# Altium schematic sheet Schematic of drumpad.schdoc
size 252 x 147 mm
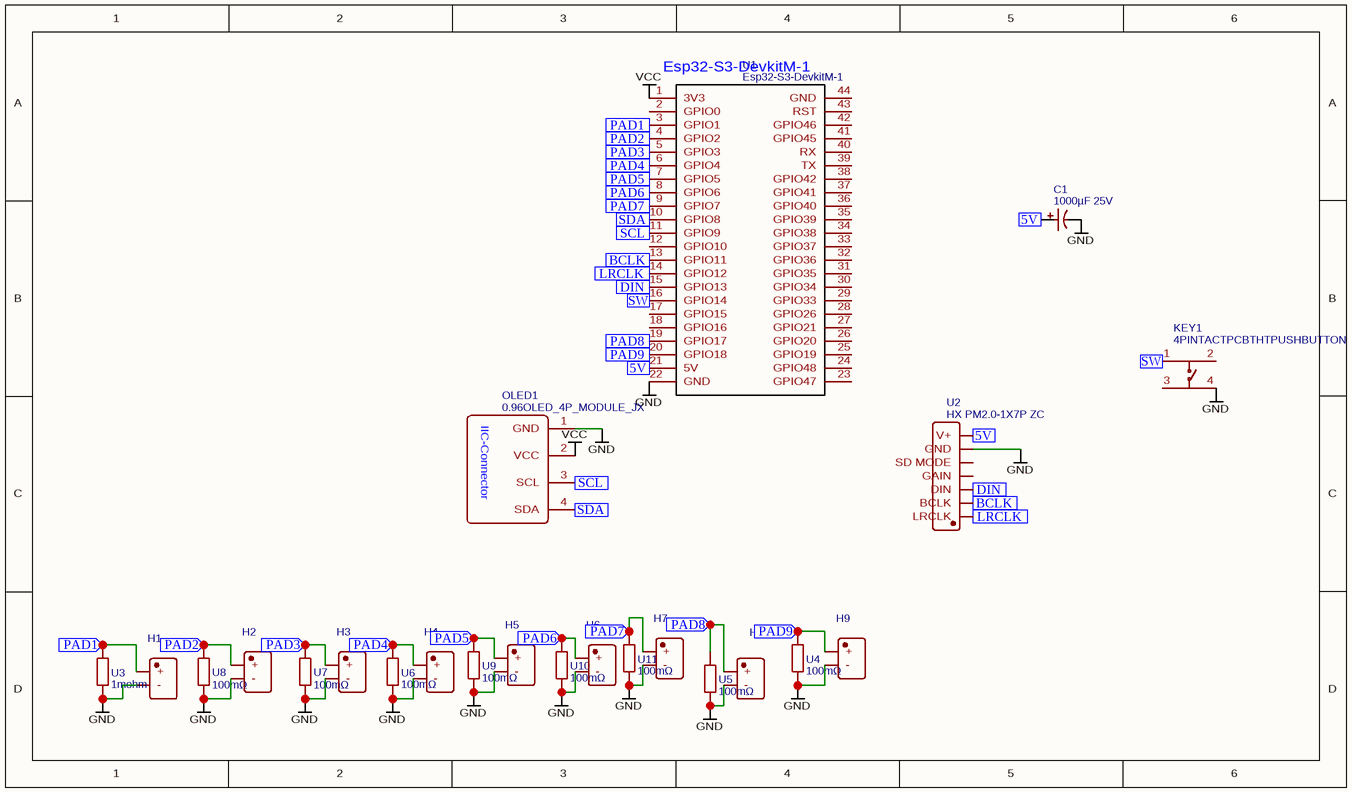
[diagram p0: Schematic of drumpad.schdoc]

## Parts
C1  1000µF 25V  [CAP-TH_BD10.0-P5.00-D1.0-FD]
H1  880-70-002-10-001101  [HDR-TH_2P-P2.00-V-M]  (value not drawn)
H2  880-70-002-10-001101  [HDR-TH_2P-P2.00-V-M]  (value not drawn)
H3  880-70-002-10-001101  [HDR-TH_2P-P2.00-V-M]  (value not drawn)
H4  880-70-002-10-001101  [HDR-TH_2P-P2.00-V-M]  (value not drawn)
H5  880-70-002-10-001101  [HDR-TH_2P-P2.00-V-M]  (value not drawn)
H6  880-70-002-10-001101  [HDR-TH_2P-P2.00-V-M]  (value not drawn)
H7  880-70-002-10-001101  [HDR-TH_2P-P2.00-V-M]  (value not drawn)
H8  880-70-002-10-001101  [HDR-TH_2P-P2.00-V-M]  (value not drawn)
H9  880-70-002-10-001101  [HDR-TH_2P-P2.00-V-M]  (value not drawn)
KEY1  4PINTACTPCBTHTPUSHBUTTON  [SW-SMD_4P-L6.0-W6.0-P4.50-LS10.0_TL3301EF160QG]
OLED1  0.96OLED_4P_MODULE_JX  [0.96OLED_4P]
U1  Esp32-S3-DevkitM-1  [ESP32-S3-DEVKITM-1]
U2  HX PM2.0-1X7P ZC  [HDR-TH_HX-PM2.0-1X7P-ZC]
U3  1mohm  [RES-TH_BD3.5-L9.0-P13.00-D0.5]
U4  100mΩ  [RES-TH_BD3.5-L9.0-P13.00-D0.5]
U5  100mΩ  [RES-TH_BD3.5-L9.0-P13.00-D0.5]
U6  100mΩ  [RES-TH_BD3.5-L9.0-P13.00-D0.5]
U7  100mΩ  [RES-TH_BD3.5-L9.0-P13.00-D0.5]
U8  100mΩ  [RES-TH_BD3.5-L9.0-P13.00-D0.5]
U9  100mΩ  [RES-TH_BD3.5-L9.0-P13.00-D0.5]
U10  100mΩ  [RES-TH_BD3.5-L9.0-P13.00-D0.5]
U11  100mΩ  [RES-TH_BD3.5-L9.0-P13.00-D0.5]

## Ports
5V (in), BCLK (in), DIN (in), LRCLK (in), PAD1 (in), PAD2 (in), PAD3 (in), PAD4 (in), PAD5 (in), PAD6 (in), PAD7 (in), PAD8 (in), PAD9 (in), SCL (in), SDA (in), SW (in)

## Nets
GND: C1.2 H1.2(-) H2.2(-) H3.2(-) H4.2(-) H5.2(-) H6.2(-) H7.2(-) H8.2(-) H9.2(-) KEY1.4 OLED1.1(GND) U1.22(GND) U2.6(GND) U3.1 U4.1 U5.1 U6.1 U7.1 U8.1 U9.1 U10.1 U11.1
VCC: OLED1.2(VCC) U1.1(3V3)
5V: C1.1 U1.21(5V) U2.7(V+) ; port 5V
BCLK: U1.13(GPIO11) U2.2(BCLK) ; port BCLK
DIN: U1.15(GPIO13) U2.3(DIN) ; port DIN
LRCLK: U1.14(GPIO12) U2.1(LRCLK) ; port LRCLK
PAD1: H1.1(+) U1.3(GPIO1) U3.2 ; port PAD1
PAD2: H2.1(+) U1.4(GPIO2) U8.2 ; port PAD2
PAD3: H3.1(+) U1.5(GPIO3) U7.2 ; port PAD3
PAD4: H4.1(+) U1.6(GPIO4) U6.2 ; port PAD4
PAD5: H5.1(+) U1.7(GPIO5) U9.2 ; port PAD5
PAD6: H6.1(+) U1.8(GPIO6) U10.2 ; port PAD6
PAD7: H7.1(+) U1.9(GPIO7) U11.2 ; port PAD7
PAD8: H8.1(+) U1.19(GPIO17) U5.2 ; port PAD8
PAD9: H9.1(+) U1.20(GPIO18) U4.2 ; port PAD9
SCL: OLED1.3(SCL) U1.11(GPIO9) ; port SCL
SDA: OLED1.4(SDA) U1.10(GPIO8) ; port SDA
SW: KEY1.1 U1.16(GPIO14) ; port SW

Not connected (* = marked no-connect by the designer): KEY1 2 3; U1 2(GPIO0) 12(GPIO10) 17(GPIO15) 18(GPIO16) 23(GPIO47) 24(GPIO48) 25(GPIO19) 26(GPIO20) 27(GPIO21) 28(GPIO26) 29(GPIO33) 30(GPIO34) 31(GPIO35) 32(GPIO36) 33(GPIO37) 34(GPIO38) 35(GPIO39) 36(GPIO40) 37(GPIO41) 38(GPIO42) 39(TX) 40(RX) 41(GPIO45) 42(GPIO46) 43(RST) 44(GND); U2 4(GAIN) 5(SD_MODE)

## Notes on the sheet
- (in symbol 0.96OLED_4P_MODULE_JX) IIC-Connector

## Library data of the parts
C1 = 1000µF 25V: Manufacturer: CapXon; Manufacturer Part: KF102M025G160A; nameAlias: Capacitance; Contributor: davitekdm; Supplier: LCSC; Supplier Part: C89783; JLCPCB Part Class: Extended Part; spicePre: C; spiceSymbolName: KF102M025G160A
H1-H9 = 880-70-002-10-001101: Manufacturer: Preci-Dip; Contributor: lcsc; Supplier: LCSC; Supplier Part: C7200794; Manufacturer Part: 880-70-002-10-001101; JLCPCB Part Class: Extended Part; spicePre: H; spiceSymbolName: 880-70-002-10-001101
KEY1 = 4PINTACTPCBTHTPUSHBUTTON: Manufacturer: null; Contributor: LCSC; Supplier: LCSC; Supplier Part: C9900003768; Manufacturer Part: 4pinTACTPCBTHTPushButton; JLCPCB Part Class: Extended Part; spicePre: K; spiceSymbolName: 4PINTACTPCBTHTPUSHBUTTON
OLED1 = 0.96OLED_4P_MODULE_JX: Manufacturer: null; Contributor: LCSC; Supplier: LCSC; Supplier Part: C9900004566; Manufacturer Part: 0.96OLED_4P_MODULE_JX; JLCPCB Part Class: Extended Part; spicePre: O; spiceSymbolName: 0.96OLED_4P_MODULE_JX
U1 = Esp32-S3-DevkitM-1: Manufacturer: Espressif Systems; Contributor: minabello1994; Manufacturer Part: Esp32-S3-DevkitM-1; link: https://www.espressif.com/sites/default/files/documentation/esp32-s3_datasheet_en.pdf; spicePre: U; spiceSymbolName: Esp32-S3-DevkitM-1
U2 = HX PM2.0-1X7P ZC: Manufacturer: hanxia(韩下); Contributor: lcsc; Supplier: LCSC; Supplier Part: C22438139; Manufacturer Part: HX PM2.0-1x7P ZC; JLCPCB Part Class: Extended Part; spicePre: U; spiceSymbolName: HX PM2.0-1X7P ZC
U3 = 1mohm: Manufacturer: VO(翔胜); Manufacturer Part: CR1/2W-0Ω1±5%-2T52; Contributor: lcsc; nameAlias: Value; Supplier: LCSC; Supplier Part: C2894388; JLCPCB Part Class: Extended Part; spicePre: U; spiceSymbolName: CR1/2W-0Ω1±5%-2T52
U4-U11 = 100mΩ: Manufacturer: VO(翔胜); Manufacturer Part: CR1/2W-0Ω1±5%-2T52; Contributor: lcsc; nameAlias: Value; Supplier: LCSC; Supplier Part: C2894388; JLCPCB Part Class: Extended Part; spicePre: U; spiceSymbolName: CR1/2W-0Ω1±5%-2T52